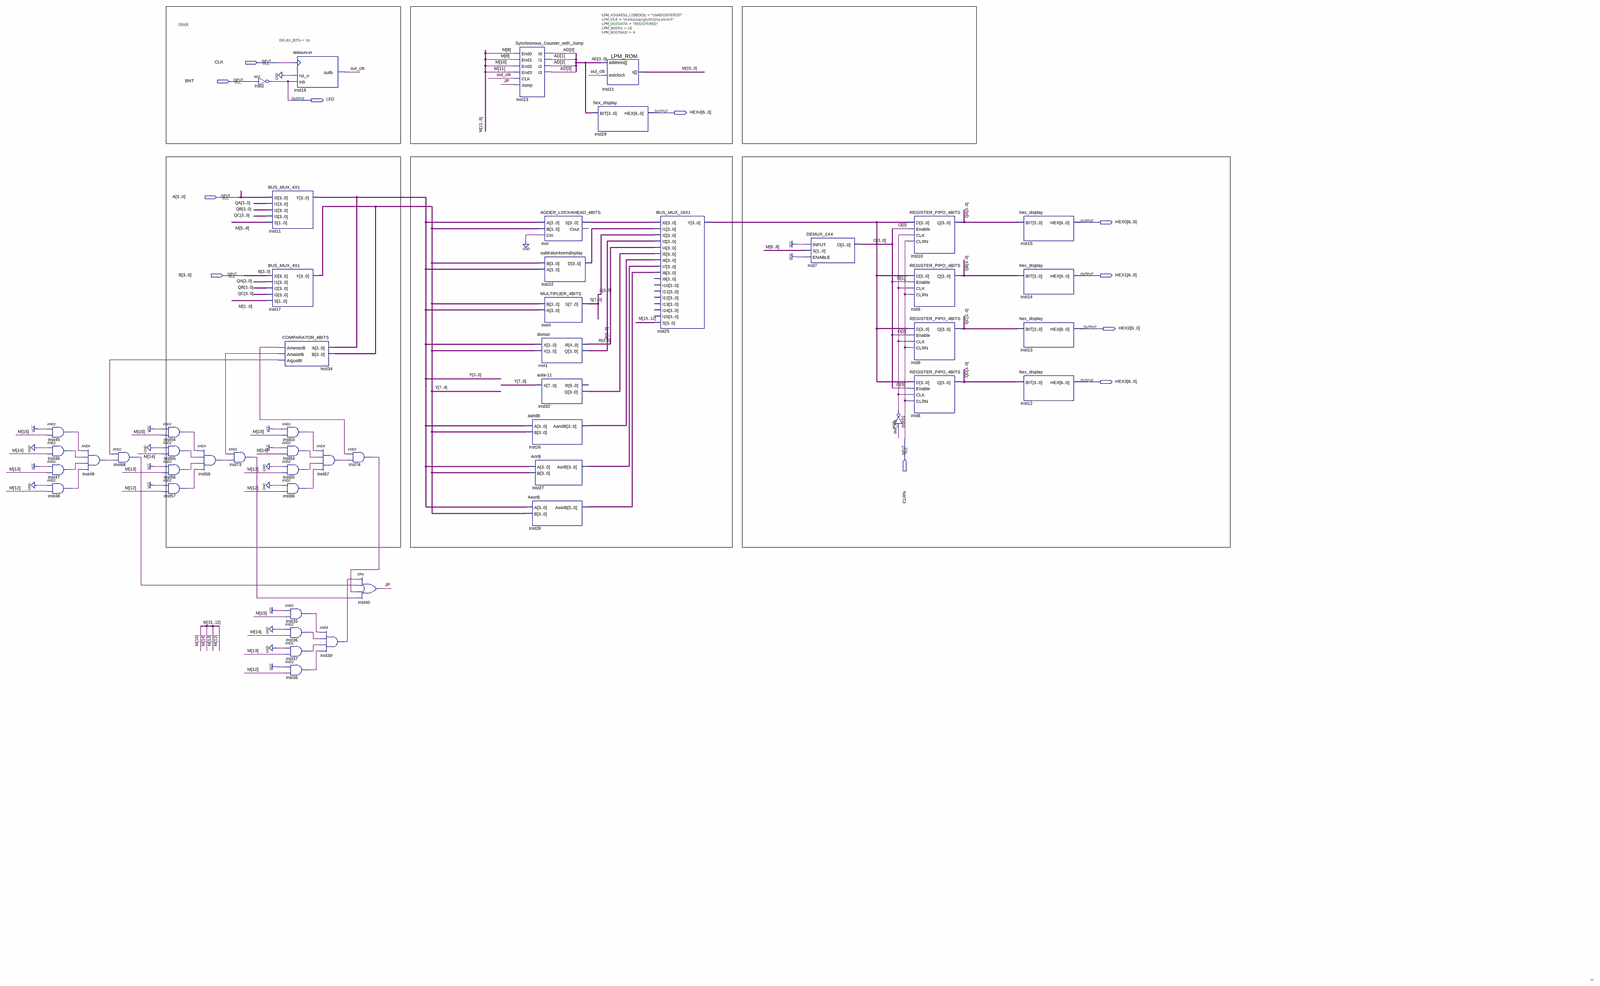
[diagram p0: schematic sheet, whole]
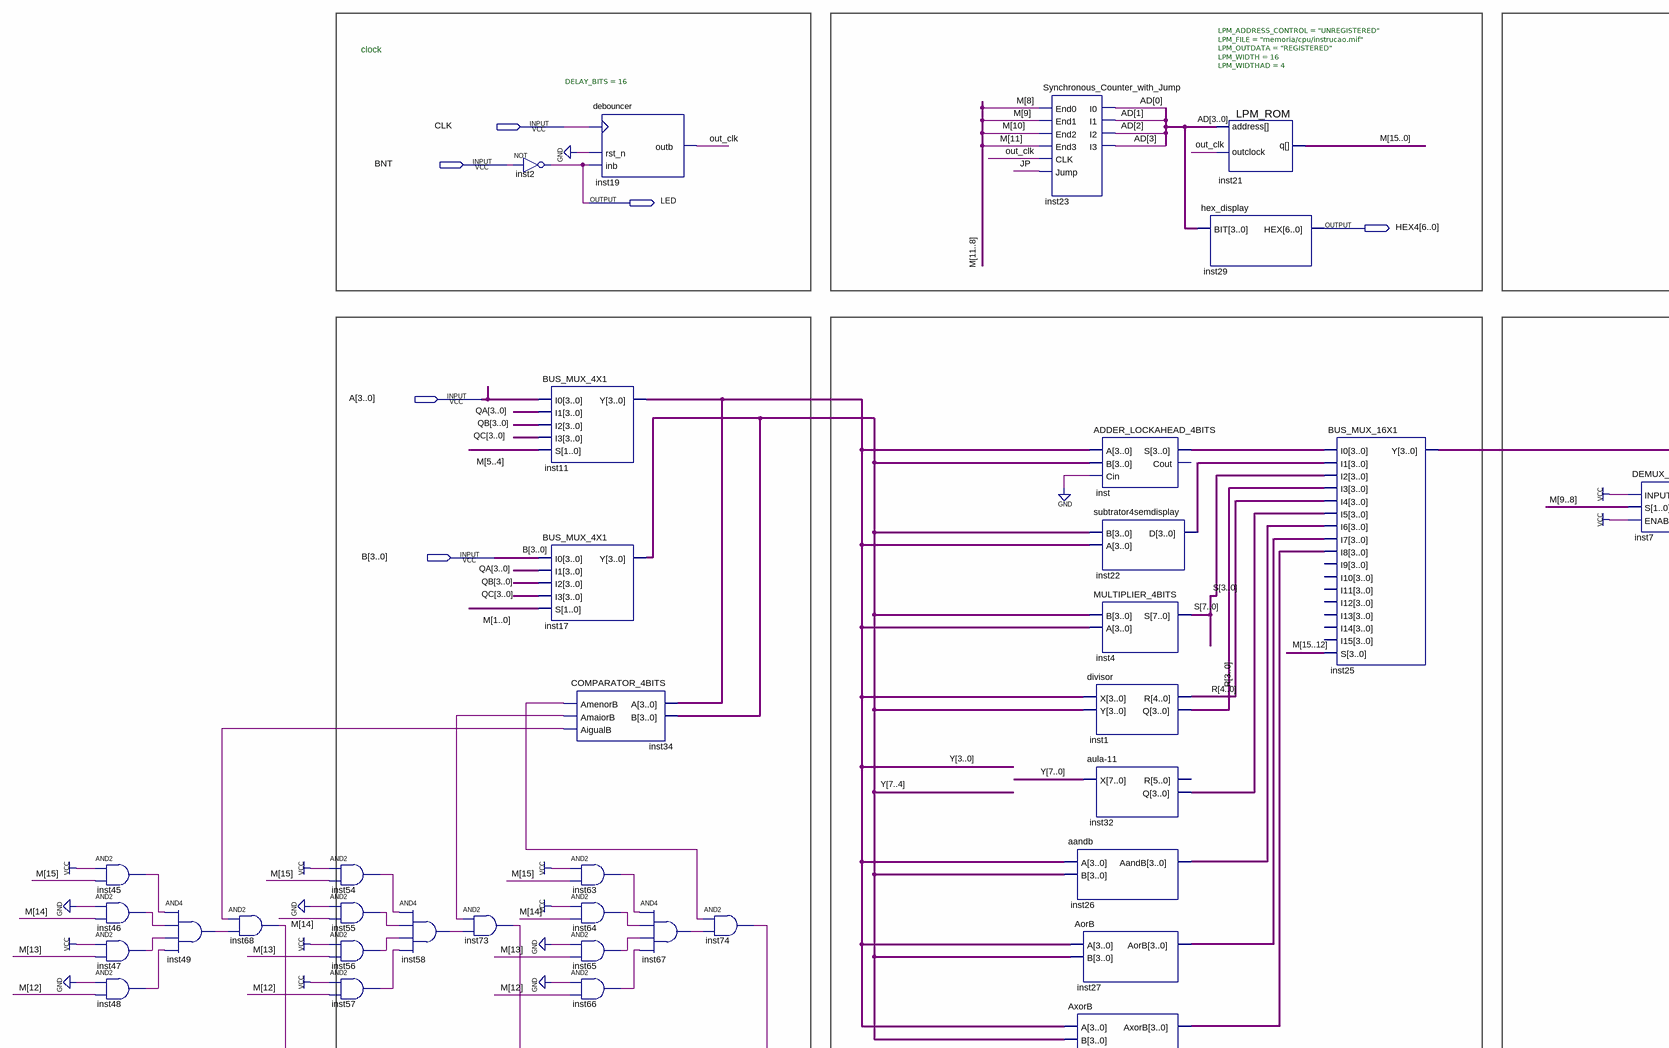
[diagram p1: schematic sheet, upper left part]
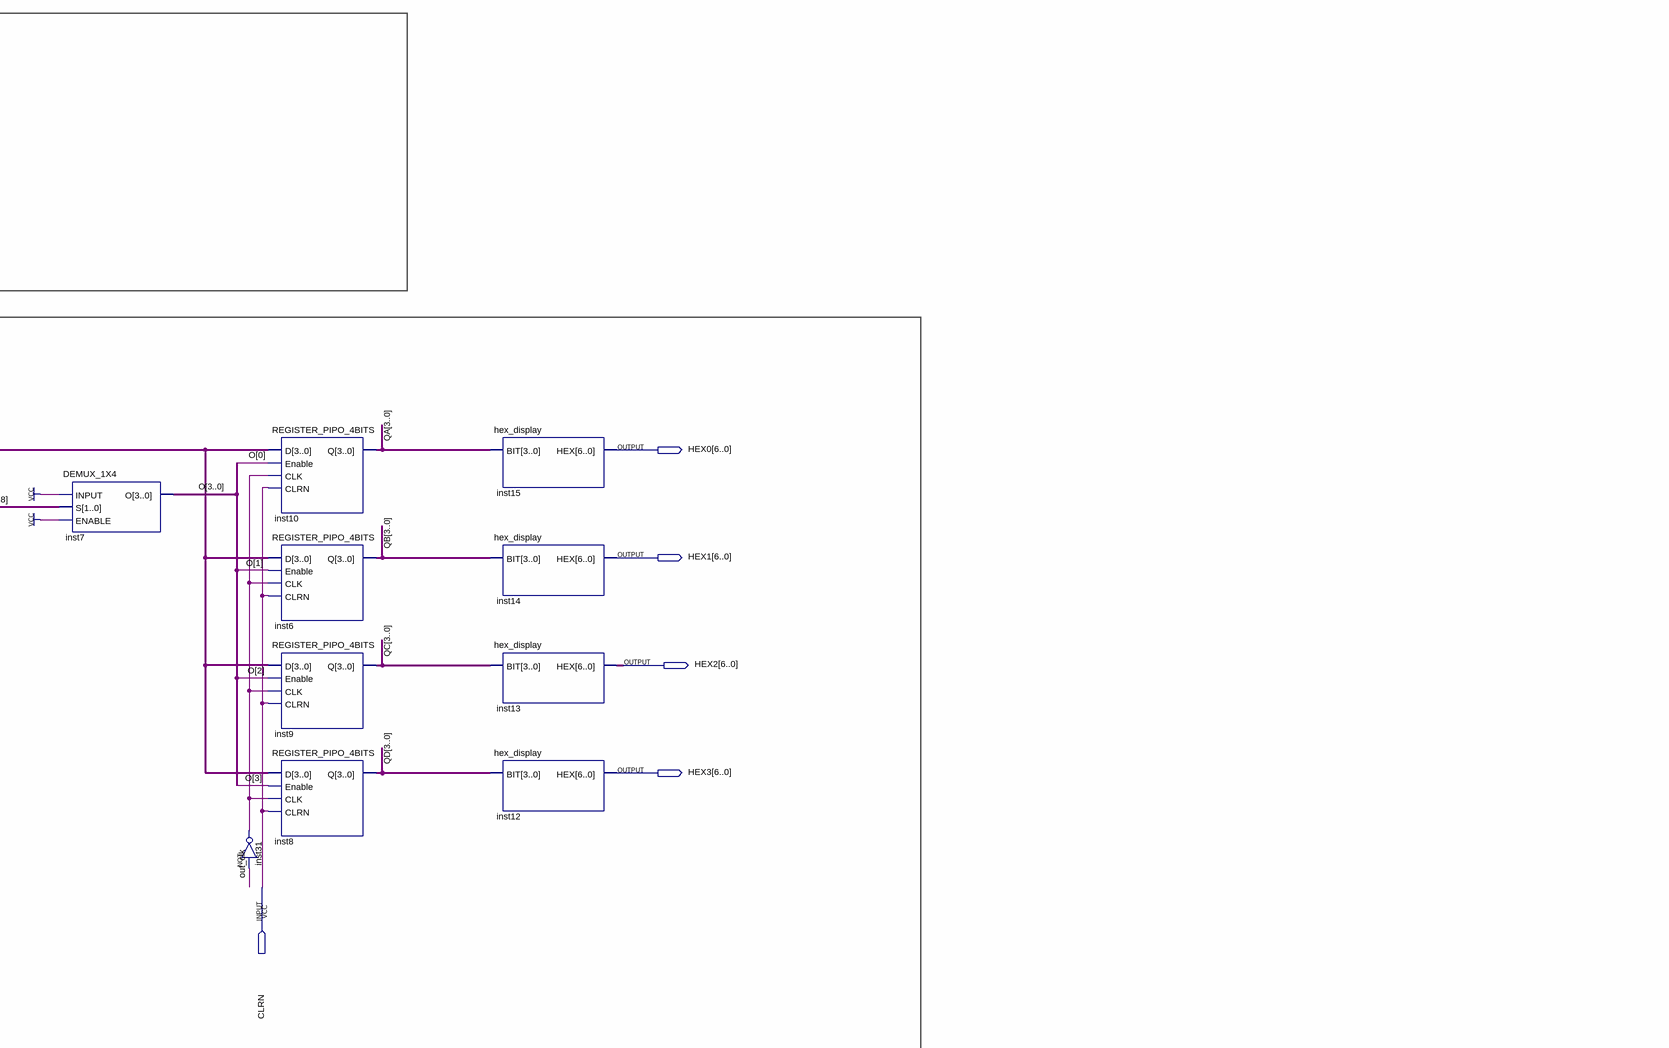
[diagram p2: schematic sheet, upper right part]
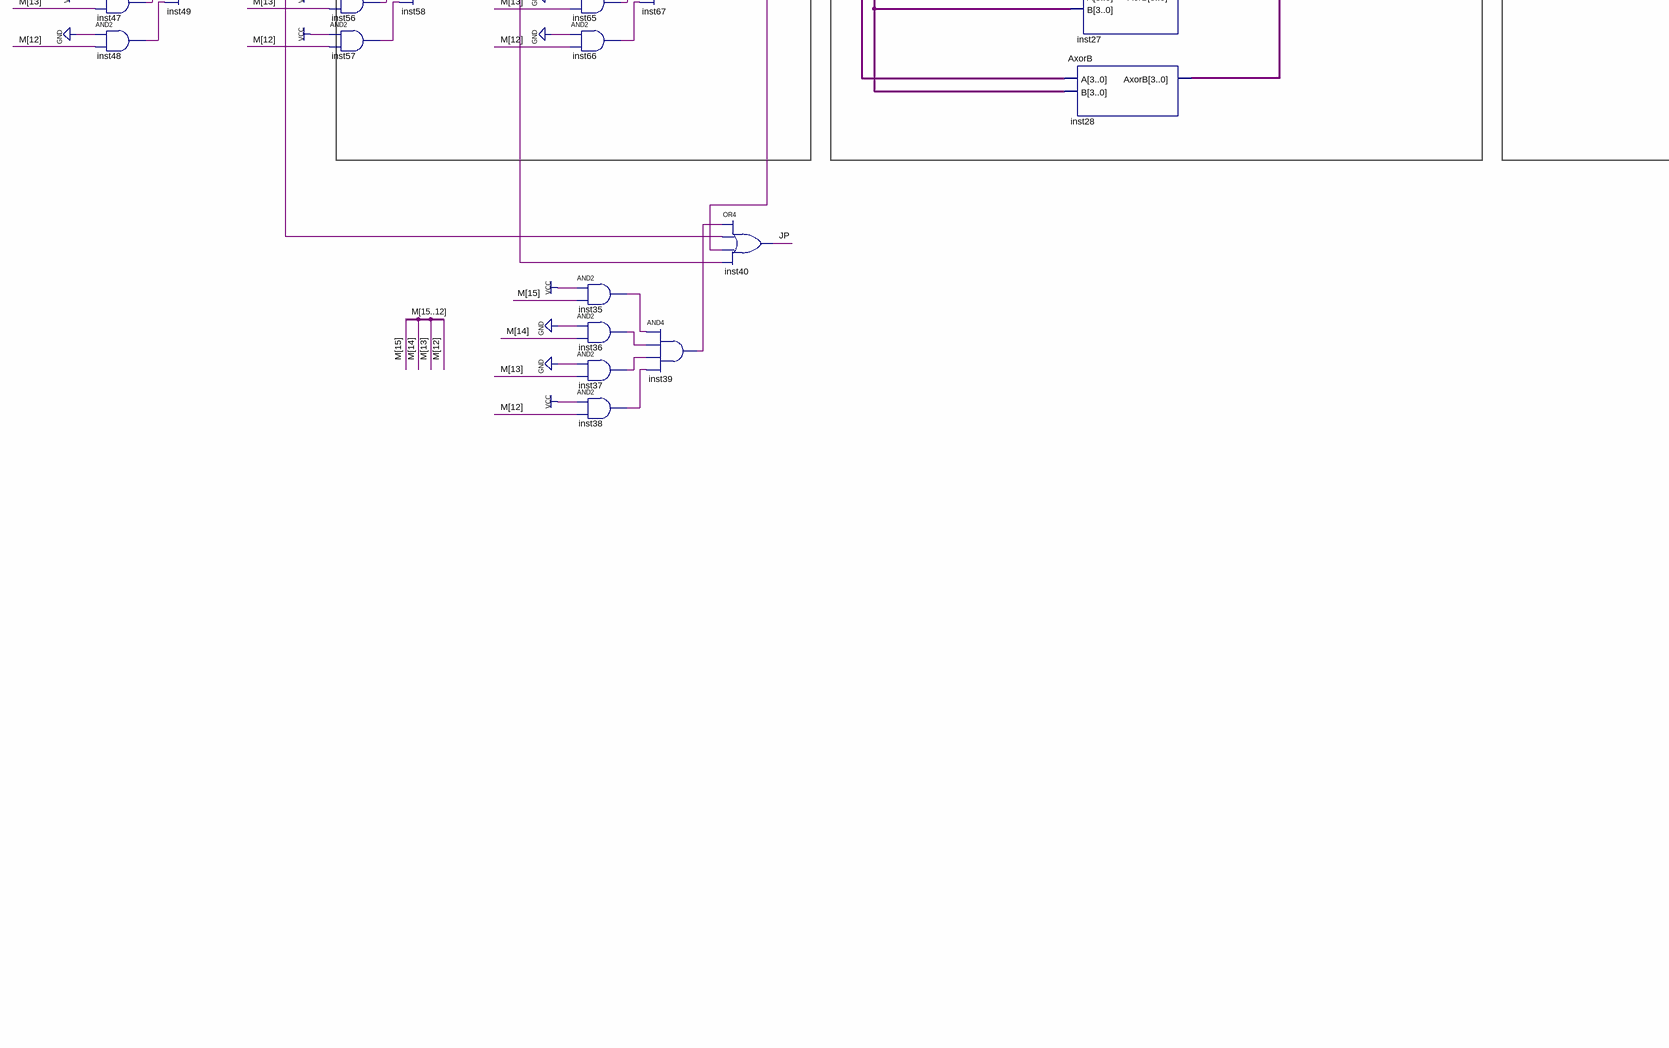
[diagram p3: schematic sheet, lower left part]
// Quartus schematic projeto.bdf as structural Verilog: 51 symbols, 11 pins
module projeto (
  input  CLK,
  input  BNT,
  input  [3:0] A,
  input  [3:0] B,
  input  CLRN,
  output LED,
  output [6:0] HEX4,
  output [6:0] HEX0,
  output [6:0] HEX1,
  output [6:0] HEX2,
  output [6:0] HEX3
);

  wire inst31_out, inst34_aigualb, inst34_amaiorb, inst34_amenorb, inst35_out, inst36_out, inst37_out,
       inst38_out, inst39_out, inst45_out, inst46_out, inst47_out, inst48_out, inst49_out, inst54_out,
       inst55_out, inst56_out, inst57_out, inst58_out, inst63_out, inst64_out, inst65_out, inst66_out,
       inst67_out, inst68_out, inst73_out, inst74_out, JP, out_clk;
  wire [3:0] AD, inst1_q, inst22_d, inst25_y, inst26_aandb, inst27_aorb, inst28_axorb, inst32_q, inst_s, O,
       QA, QB, QC, QD;
  wire [4:0] R;
  wire [7:0] S, Y;
  wire [15:0] M;

  and inst45 (inst45_out, 1'b1, M[15]);
  and inst46 (inst46_out, 1'b0, M[14]);
  and inst47 (inst47_out, 1'b1, M[13]);
  and inst48 (inst48_out, 1'b0, M[12]);
  and inst49 (inst49_out, inst45_out, inst46_out, inst47_out, inst48_out);
  and inst68 (inst68_out, inst34_aigualb, inst49_out);
  and inst54 (inst54_out, 1'b1, M[15]);
  and inst55 (inst55_out, 1'b0, M[14]);
  and inst56 (inst56_out, 1'b1, M[13]);
  and inst57 (inst57_out, 1'b1, M[12]);
  and inst58 (inst58_out, inst54_out, inst55_out, inst56_out, inst57_out);
  and inst73 (inst73_out, inst34_amaiorb, inst58_out);
  not inst2 (LED, BNT);
  BUS_MUX_4X1 inst11 (.I0(A), .I1(QA), .I2(QB), .I3(QC), .S(M[5:4]), .Y(Y[3:0]));
  BUS_MUX_4X1 inst17 (.I0(B), .I1(QA), .I2(QB), .I3(QC), .S(M[1:0]), .Y(Y[7:4]));
  debouncer #(.DELAY_BITS(16)) inst19 (.clk(CLK), .inb(LED), .rst_n(1'b0), .outb(out_clk));
  COMPARATOR_4BITS inst34 (
    .A(Y[3:0]), .B(Y[7:4]), .AmenorB(inst34_amenorb), .AmaiorB(inst34_amaiorb), .AigualB(inst34_aigualb));
  and inst63 (inst63_out, 1'b1, M[15]);
  and inst64 (inst64_out, 1'b1, M[14]);
  and inst65 (inst65_out, 1'b0, M[13]);
  and inst66 (inst66_out, 1'b0, M[12]);
  and inst35 (inst35_out, 1'b1, M[15]);
  and inst36 (inst36_out, 1'b0, M[14]);
  and inst37 (inst37_out, 1'b0, M[13]);
  and inst38 (inst38_out, 1'b1, M[12]);
  and inst67 (inst67_out, inst63_out, inst64_out, inst65_out, inst66_out);
  and inst39 (inst39_out, inst35_out, inst36_out, inst37_out, inst38_out);
  and inst74 (inst74_out, inst34_amenorb, inst67_out);
  or inst40 (JP, inst39_out, inst68_out, inst74_out, inst73_out);
  Synchronous_Counter_with_Jump inst23 (
    .End0(M[8]), .End1(M[9]), .End2(M[10]), .End3(M[11]), .CLK(out_clk), .Jump(JP), .I0(AD[0]), .I1(AD[1]),
    .I2(AD[2]), .I3(AD[3]));
  ADDER_LOCKAHEAD_4BITS inst (.Cin(1'b0), .B(Y[7:4]), .A(Y[3:0]), .S(inst_s));  // open: Cout
  subtrator4semdisplay inst22 (.B(Y[7:4]), .A(Y[3:0]), .D(inst22_d));
  MULTIPLIER_4BITS inst4 (.B(Y[7:4]), .A(Y[3:0]), .S(S));
  divisor inst1 (.X(Y[3:0]), .Y(Y[7:4]), .R(R), .Q(inst1_q));
  \aula-11  inst32 (.X(Y), .Q(inst32_q));  // open: R
  aandb inst26 (.A(Y[3:0]), .B(Y[7:4]), .AandB(inst26_aandb));
  AorB inst27 (.A(Y[3:0]), .B(Y[7:4]), .AorB(inst27_aorb));
  AxorB inst28 (.A(Y[3:0]), .B(Y[7:4]), .AxorB(inst28_axorb));
  hex_display inst29 (.BIT(AD), .HEX(HEX4));
  LPM_ROM #(.LPM_ADDRESS_CONTROL("UNREGISTERED"), .LPM_FILE("memoria/cpu/instrucao.mif"), .LPM_OUTDATA("REGISTERED"), .LPM_WIDTH(16), .LPM_WIDTHAD(4)) inst21 (
    .address(AD), .outclock(out_clk), .q(M));
  BUS_MUX_16X1 inst25 (
    .I0(inst_s), .I1(inst22_d), .I2(S[3:0]), .I3(inst1_q), .I4(R[3:0]), .I5(inst32_q), .I6(inst26_aandb),
    .I7(inst27_aorb), .I8(inst28_axorb), .S(M[15:12]), .Y(inst25_y));  // open: I9, I10, I11, I12, I13, I14, I15
  DEMUX_1X4 inst7 (.INPUT(1'b1), .S(M[9:8]), .ENABLE(1'b1), .O(O));
  not inst31 (inst31_out, out_clk);
  REGISTER_PIPO_4BITS inst10 (.D(inst25_y), .Enable(O[0]), .CLK(inst31_out), .CLRN(CLRN), .Q(QA));
  REGISTER_PIPO_4BITS inst6 (.D(inst25_y), .Enable(O[1]), .CLK(inst31_out), .CLRN(CLRN), .Q(QB));
  REGISTER_PIPO_4BITS inst9 (.D(inst25_y), .Enable(O[2]), .CLK(inst31_out), .CLRN(CLRN), .Q(QC));
  REGISTER_PIPO_4BITS inst8 (.D(inst25_y), .Enable(O[3]), .CLK(inst31_out), .CLRN(CLRN), .Q(QD));
  hex_display inst15 (.BIT(QA), .HEX(HEX0));
  hex_display inst14 (.BIT(QB), .HEX(HEX1));
  hex_display inst13 (.BIT(QC), .HEX(HEX2));
  hex_display inst12 (.BIT(QD), .HEX(HEX3));

  // Notes on the sheet:
  //   clock
endmodule
